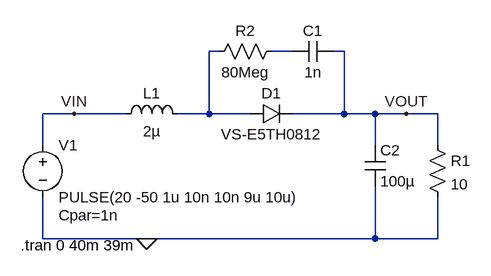
[diagram p0: schematic snubber_diode.asc]
snubber_diode.asc, the LTspice schematic file:
Version 4
SHEET 1 880 680
WIRE 192 16 176 16
WIRE 304 16 272 16
WIRE 384 16 368 16
WIRE -32 112 -80 112
WIRE 48 112 -32 112
WIRE 176 112 176 16
WIRE 176 112 128 112
WIRE 240 112 176 112
WIRE 384 112 384 16
WIRE 384 112 304 112
WIRE 432 112 384 112
WIRE 480 112 432 112
WIRE 528 112 480 112
WIRE -80 160 -80 112
WIRE 432 160 432 112
WIRE 528 160 528 112
WIRE -80 304 -80 240
WIRE 80 304 -80 304
WIRE 432 304 432 224
WIRE 432 304 80 304
WIRE 528 304 528 240
WIRE 528 304 432 304
FLAG 480 112 VOUT
FLAG -32 112 VIN
FLAG 80 304 0
SYMBOL ind 32 128 R270
WINDOW 0 32 56 VTop 2
WINDOW 3 5 56 VBottom 2
SYMATTR InstName L1
SYMATTR Value 2µ
SYMATTR SpiceLine Rser=1
SYMBOL res 512 144 R0
SYMATTR InstName R1
SYMATTR Value 10
SYMBOL diode 240 128 R270
WINDOW 0 32 32 VTop 2
WINDOW 3 0 32 VBottom 2
SYMATTR InstName D1
SYMATTR Value VS-E5TH0812
SYMBOL res 288 0 R90
WINDOW 0 0 56 VBottom 2
WINDOW 3 32 56 VTop 2
SYMATTR InstName R2
SYMATTR Value 80Meg
SYMBOL cap 368 0 R90
WINDOW 0 0 32 VBottom 2
WINDOW 3 32 32 VTop 2
SYMATTR InstName C1
SYMATTR Value 1n
SYMBOL cap 416 160 R0
SYMATTR InstName C2
SYMATTR Value 100µ
SYMBOL voltage -80 144 R0
WINDOW 123 0 0 Left 0
WINDOW 39 24 124 Left 2
SYMATTR InstName V1
SYMATTR Value PULSE(20 -50 1u 10n 10n 9u 10u)
SYMATTR SpiceLine Cpar=1n
TEXT -114 314 Left 2 !.tran 0 40m 39m

The netlist it stands for:
* snubber_diode.asc
L1 VIN N001 2µ Rser=1
R1 VOUT 0 10
D1 N001 VOUT VS-E5TH0812
R2 N002 N001 80Meg
C1 VOUT N002 1n
C2 VOUT 0 100µ
V1 VIN 0 PULSE(20 -50 1u 10n 10n 9u 10u) Cpar=1n
.model D D
.lib standard.dio
.tran 0 40m 39m
.backanno
.end